# EAGLE design MiniConsoleTFT114 (EAGLE 9.6.2)
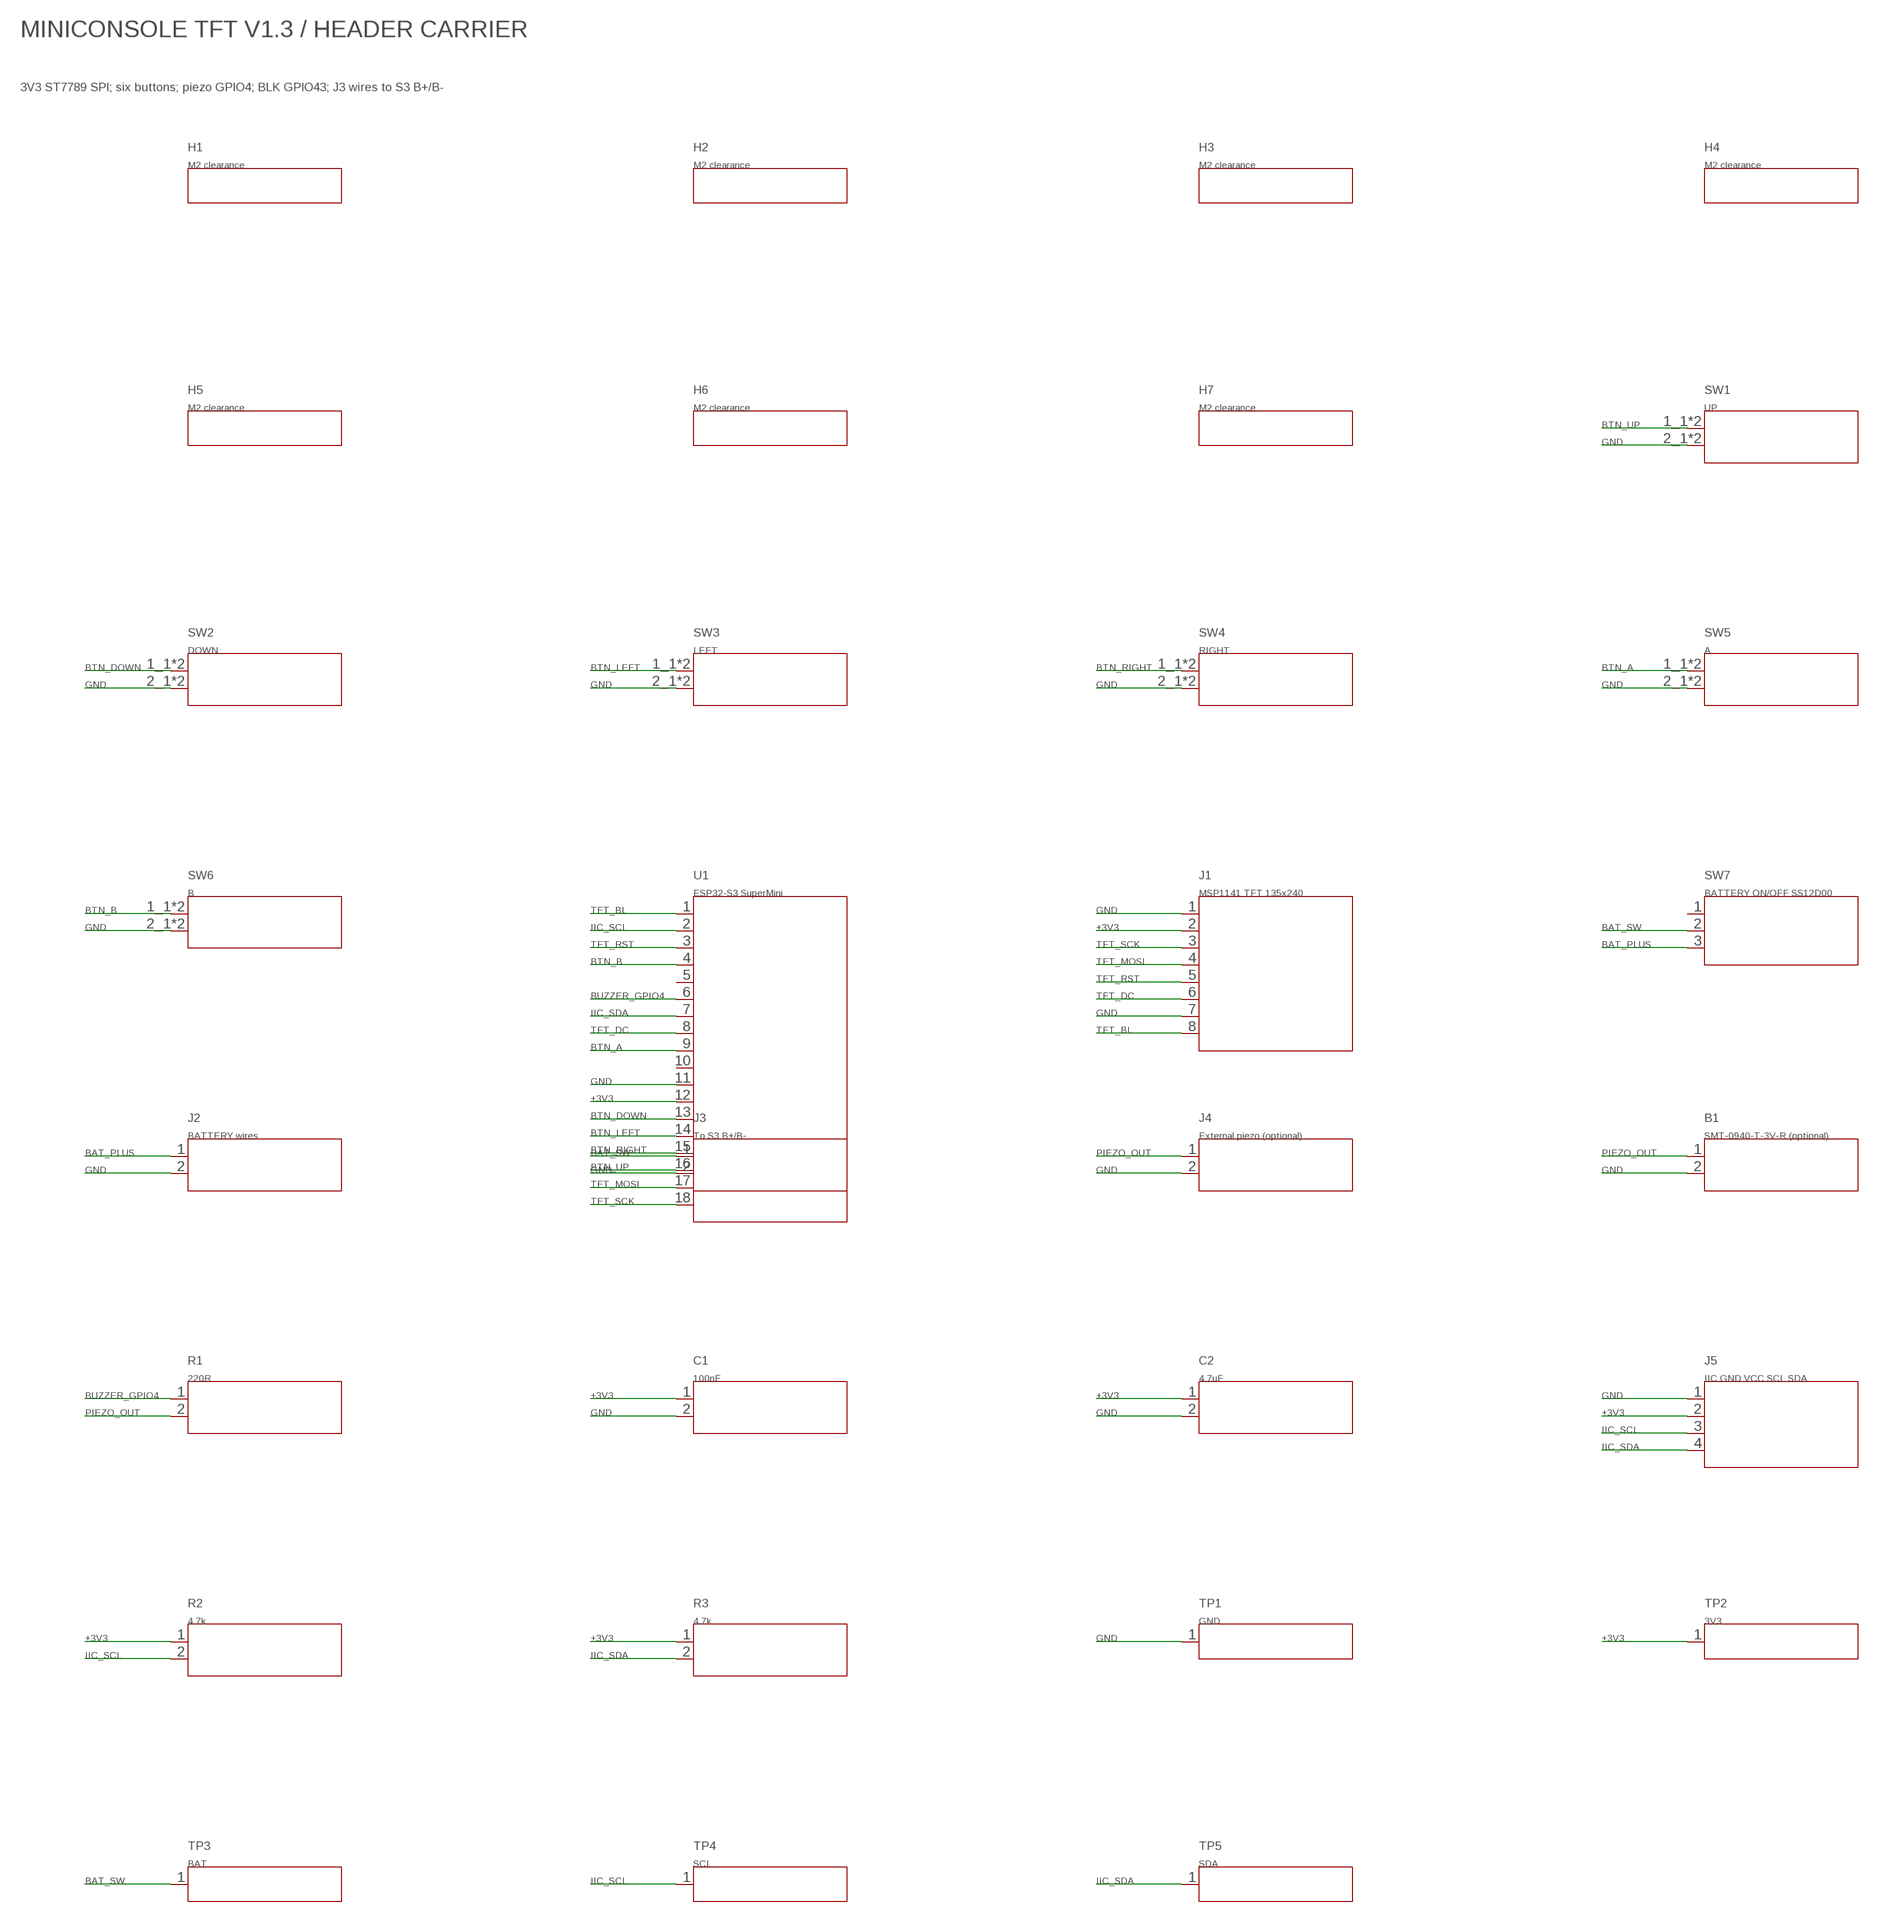
[diagram p0: schematic, sheet 1]

## Parts
B1  SMT-0940-T-3V-R (optional)  Piezo_PUI_SMT0940_180_B1  [Piezo_PUI_SMT0940_180_B1]
C1  100nF  C_0603_180_C1  [C_0603_180_C1]
C2  4.7uF  C_0805_4u7_C2  [C_0805_4u7_C2]
H1  M2 clearance  Mount_M2_H1  [Mount_M2_H1]
H2  M2 clearance  Mount_M2_H2  [Mount_M2_H2]
H3  M2 clearance  Mount_M2_H3  [Mount_M2_H3]
H4  M2 clearance  Mount_M2_H4  [Mount_M2_H4]
H5  M2 clearance  Mount_M2_H5  [Mount_M2_H5]
H6  M2 clearance  Mount_M2_H6  [Mount_M2_H6]
H7  M2 clearance  Mount_M2_H7  [Mount_M2_H7]
J1  MSP1141 TFT 135x240  TFT_MSP1141_1x08_J1  [TFT_MSP1141_1x08_J1]
J2  BATTERY wires  Wire_2x_2.54_Reverse_J2  [Wire_2x_2.54_Reverse_J2]
J3  To S3 B+/B-  Wire_2x_2.54_J3  [Wire_2x_2.54_J3]
J4  External piezo (optional)  Wire_2x_2.54_Reverse_J4  [Wire_2x_2.54_Reverse_J4]
J5  IIC GND VCC SCL SDA  IIC_1x04_J5  [IIC_1x04_J5]
R1  220R  R_Axial_DIN0207_P7.62_220R_R1  [R_Axial_DIN0207_P7.62_220R_R1]
R2  4.7k  R_0603_R2  [R_0603_R2]
R3  4.7k  R_0603_R3  [R_0603_R3]
SW1  UP  SW_6mm_SW1  [SW_6mm_SW1]
SW2  DOWN  SW_6mm_SW2  [SW_6mm_SW2]
SW3  LEFT  SW_6mm_90_SW3  [SW_6mm_90_SW3]
SW4  RIGHT  SW_6mm_90_SW4  [SW_6mm_90_SW4]
SW5  A  SW_6mm_SW5  [SW_6mm_SW5]
SW6  B  SW_6mm_SW6  [SW_6mm_SW6]
SW7  BATTERY ON/OFF SS12D00  SS12D00_LeftEdge_3pin_SW7  [SS12D00_LeftEdge_3pin_SW7]
TP1  GND  TestPoint_D1p5_Rear_TP1  [TestPoint_D1p5_Rear_TP1]
TP2  3V3  TestPoint_D1p5_Rear_TP2  [TestPoint_D1p5_Rear_TP2]
TP3  BAT  TestPoint_D1p5_Rear_TP3  [TestPoint_D1p5_Rear_TP3]
TP4  SCL  TestPoint_D1p5_Rear_TP4  [TestPoint_D1p5_Rear_TP4]
TP5  SDA  TestPoint_D1p5_Rear_TP5  [TestPoint_D1p5_Rear_TP5]
U1  ESP32-S3 SuperMini  S3_Rear_USB_Down_2x09_U1  [S3_Rear_USB_Down_2x09_U1]

## Nets
+3V3: C1.1 C2.1 J1.2 J5.2 R2.1 R3.1 TP2.1 U1.12
BAT_PLUS: J2.1 SW7.3
BAT_SW: J3.1 SW7.2 TP3.1
BTN_A: SW5.1_1(P1) SW5.1_2(P1) U1.9
BTN_B: SW6.1_1(P1) SW6.1_2(P1) U1.4
BTN_DOWN: SW2.1_1(P1) SW2.1_2(P1) U1.13
BTN_LEFT: SW3.1_1(P1) SW3.1_2(P1) U1.14
BTN_RIGHT: SW4.1_1(P1) SW4.1_2(P1) U1.15
BTN_UP: SW1.1_1(P1) SW1.1_2(P1) U1.16
BUZZER_GPIO4: R1.1 U1.6
GND: B1.2 C1.2 C2.2 J1.1 J1.7 J2.2 J3.2 J4.2 J5.1 SW1.2_1(P2) SW1.2_2(P2) SW2.2_1(P2) SW2.2_2(P2) SW3.2_1(P2) SW3.2_2(P2) SW4.2_1(P2) SW4.2_2(P2) SW5.2_1(P2) SW5.2_2(P2) SW6.2_1(P2) SW6.2_2(P2) TP1.1 U1.11
IIC_SCL: J5.3 R2.2 TP4.1 U1.2
IIC_SDA: J5.4 R3.2 TP5.1 U1.7
PIEZO_OUT: B1.1 J4.1 R1.2
TFT_BL: J1.8 U1.1
TFT_DC: J1.6 U1.8
TFT_MOSI: J1.4 U1.17
TFT_RST: J1.5 U1.3
TFT_SCK: J1.3 U1.18
Unconnected: SW7.1 U1.5 U1.10

## Notes on the sheet
- MINICONSOLE TFT V1.3 / HEADER CARRIER
- 3V3 ST7789 SPI; six buttons; piezo GPIO4; BLK GPIO43; J3 wires to S3 B+/B-

## Library data of the parts
B1 = MiniConsole:Piezo_PUI_SMT0940_180_B1
C1 = MiniConsole:C_0603_180_C1
C2 = MiniConsole:C_0805_4u7_C2
H1 = MiniConsole:Mount_M2_H1
H2 = MiniConsole:Mount_M2_H2
H3 = MiniConsole:Mount_M2_H3
H4 = MiniConsole:Mount_M2_H4
H5 = MiniConsole:Mount_M2_H5
H6 = MiniConsole:Mount_M2_H6
H7 = MiniConsole:Mount_M2_H7
J1 = MiniConsole:TFT_MSP1141_1x08_J1
J2 = MiniConsole:Wire_2x_2.54_Reverse_J2
J3 = MiniConsole:Wire_2x_2.54_J3
J4 = MiniConsole:Wire_2x_2.54_Reverse_J4
J5 = MiniConsole:IIC_1x04_J5
R1 = MiniConsole:R_Axial_DIN0207_P7.62_220R_R1
R2 = MiniConsole:R_0603_R2
R3 = MiniConsole:R_0603_R3
SW1 = MiniConsole:SW_6mm_SW1
SW2 = MiniConsole:SW_6mm_SW2
SW3 = MiniConsole:SW_6mm_90_SW3
SW4 = MiniConsole:SW_6mm_90_SW4
SW5 = MiniConsole:SW_6mm_SW5
SW6 = MiniConsole:SW_6mm_SW6
SW7 = MiniConsole:SS12D00_LeftEdge_3pin_SW7
TP1 = MiniConsole:TestPoint_D1p5_Rear_TP1
TP2 = MiniConsole:TestPoint_D1p5_Rear_TP2
TP3 = MiniConsole:TestPoint_D1p5_Rear_TP3
TP4 = MiniConsole:TestPoint_D1p5_Rear_TP4
TP5 = MiniConsole:TestPoint_D1p5_Rear_TP5
U1 = MiniConsole:S3_Rear_USB_Down_2x09_U1

## Net classes
0 default: width 0.25 mm, drill 0.3 mm

## Board
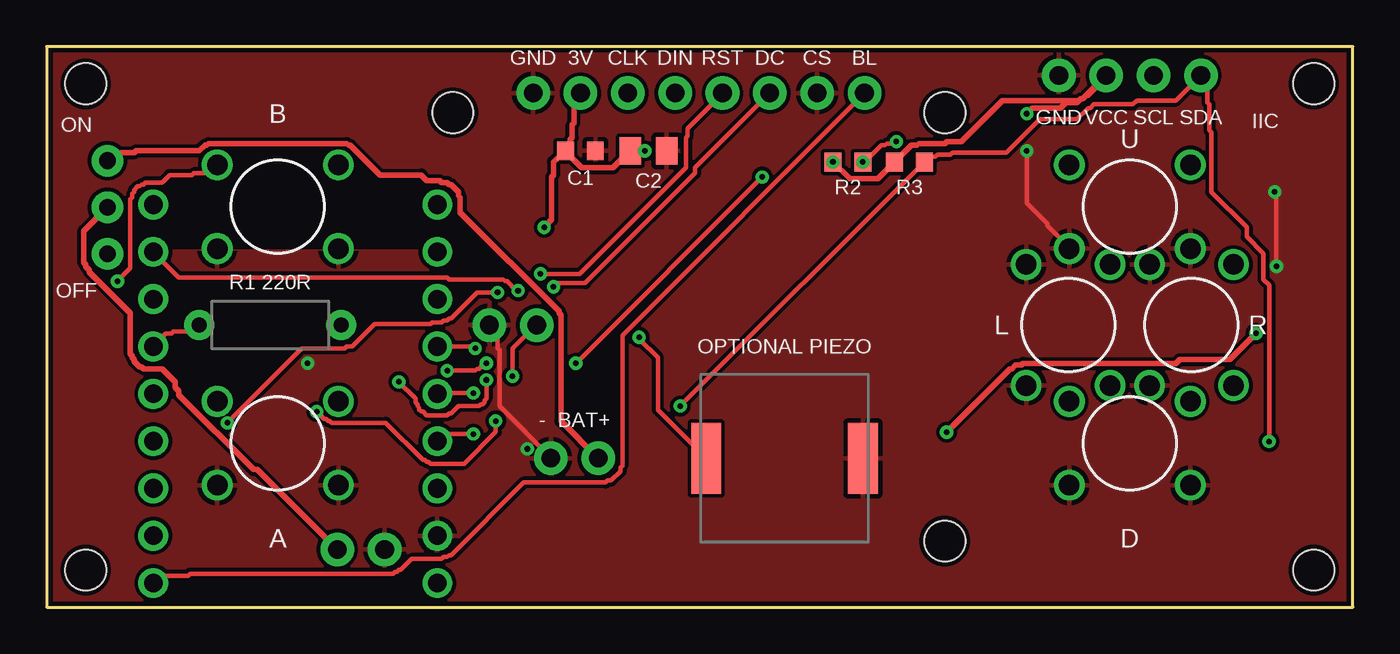
[diagram p1: board, top side]
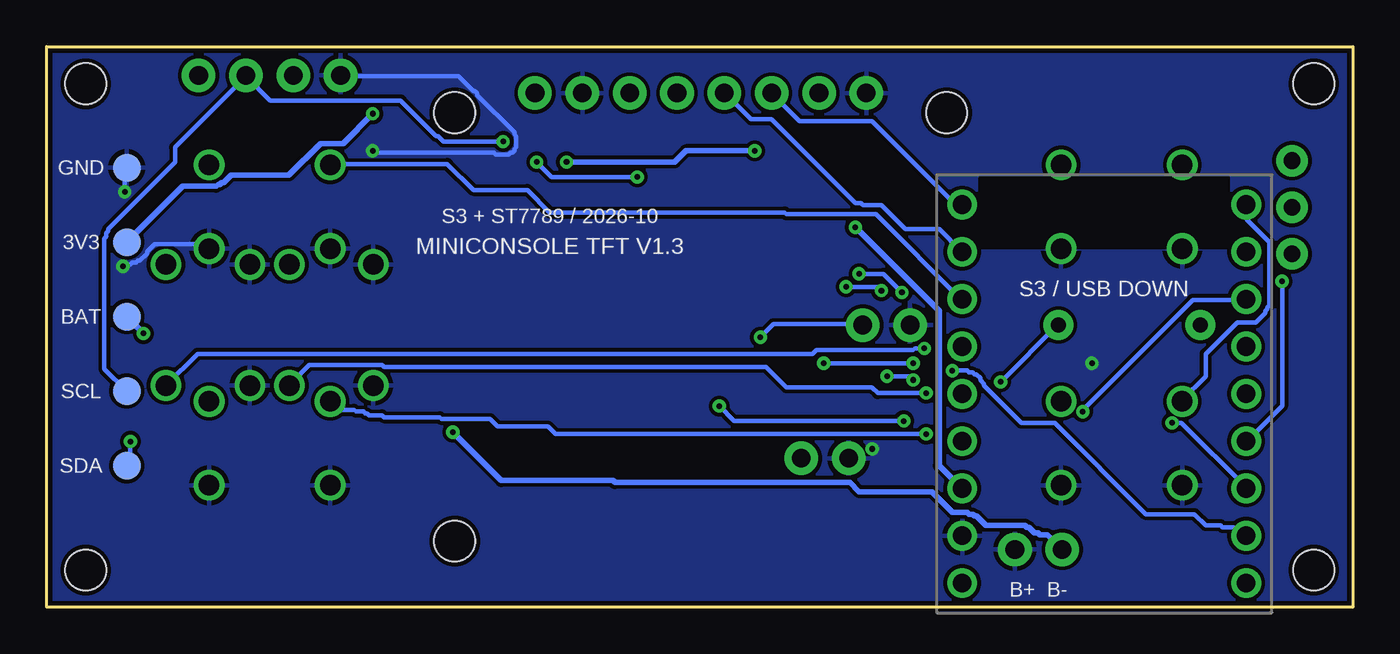
[diagram p2: board, bottom side, seen from below]

Size 70.1 x 30.1 mm. Coordinates in mm from the lower left corner, seen from the top.
Outline: 0,0 70.1,0 70.1,30.1 0,30.1 0,0
Copper layers (1*16): Top 0.035mm / dielectric 1.53mm / Bottom
Design rules "MiniConsole_2layer_0p2mm": minimum track width 0.25mm, minimum drill 0.3mm, track to track 0.2mm, track to pad 0.2mm, pad to pad 0.2mm, via to via 0.2mm, copper to edge 0.25mm, drill to drill 0.25mm, stop-mask expansion 0.05mm, thermal gap 0.25mm
tRestrict: area 6.8,19.4 to 19.9,23
bRestrict: area 6.8,19.4 to 19.9,23
vRestrict: area 6.8,19.4 to 19.9,23

### Footprints (pad centres in the part's own frame; a part is rotated, then mirrored left to right if it is on the bottom)
Piezo_PUI_SMT0940_180_B1 = smd 1.6 x 3.8: 1 -4.2,0; 2 4.2,0
C_0603_180_C1 = smd 0.9 x 1: 1 -0.8,0; 2 0.8,0
C_0805_4u7_C2 = smd 1.15 x 1.45: 1 -0.975,0; 2 0.975,0
Mount_M2_H1 = hole 2.2: 0,0
Mount_M2_H2 = hole 2.2: 0,0
Mount_M2_H3 = hole 2.2: 0,0
Mount_M2_H4 = hole 2.2: 0,0
Mount_M2_H5 = hole 2.2: 0,0
Mount_M2_H6 = hole 2.2: 0,0
Mount_M2_H7 = hole 2.2: 0,0
TFT_MSP1141_1x08_J1 = drill 1 pad 1.8 round: 1 0,0; 2 2.54,0; 3 5.08,0; 4 7.62,0; 5 10.16,0; 6 12.7,0; 7 15.24,0; 8 17.78,0
Wire_2x_2.54_Reverse_J2 = drill 1 pad 1.8 round: 1 0,0; 2 -2.54,0
Wire_2x_2.54_J3 = drill 1 pad 1.8 round: 1 0,0; 2 2.54,0
Wire_2x_2.54_Reverse_J4 = drill 1 pad 1.8 round: 1 0,0; 2 -2.54,0
IIC_1x04_J5 = drill 1 pad 1.8 round: 1 0,0; 2 2.54,0; 3 5.08,0; 4 7.62,0
R_Axial_DIN0207_P7.62_220R_R1 = drill 0.8 pad 1.6 round: 1 -3.81,0; 2 3.81,0
R_0603_R2 = smd 0.9 x 1: 1 -0.8,0; 2 0.8,0
R_0603_R3 = smd 0.9 x 1: 1 -0.8,0; 2 0.8,0
SW_6mm_SW1 = drill 1.1 pad 1.45 round: 1_1 -3.25,2.25; 1_2 3.25,2.25; 2_1 -3.25,-2.25; 2_2 3.25,-2.25
SW_6mm_SW2 = drill 1.1 pad 1.45 round: 1_1 -3.25,2.25; 1_2 3.25,2.25; 2_1 -3.25,-2.25; 2_2 3.25,-2.25
SW_6mm_90_SW3 = drill 1.1 pad 1.45 round: 1_1 2.25,3.25; 1_2 2.25,-3.25; 2_1 -2.25,3.25; 2_2 -2.25,-3.25
SW_6mm_90_SW4 = drill 1.1 pad 1.45 round: 1_1 2.25,3.25; 1_2 2.25,-3.25; 2_1 -2.25,3.25; 2_2 -2.25,-3.25
SW_6mm_SW5 = drill 1.1 pad 1.45 round: 1_1 -3.25,2.25; 1_2 3.25,2.25; 2_1 -3.25,-2.25; 2_2 3.25,-2.25
SW_6mm_SW6 = drill 1.1 pad 1.45 round: 1_1 -3.25,2.25; 1_2 3.25,2.25; 2_1 -3.25,-2.25; 2_2 3.25,-2.25
SS12D00_LeftEdge_3pin_SW7 = drill 0.9 pad 1.7 round: 1 0,-2.5; 2 0,0; 3 0,2.5
TestPoint_D1p5_Rear_TP1 = smd 1.5 x 1.5: 1 0,0
TestPoint_D1p5_Rear_TP2 = smd 1.5 x 1.5: 1 0,0
TestPoint_D1p5_Rear_TP3 = smd 1.5 x 1.5: 1 0,0
TestPoint_D1p5_Rear_TP4 = smd 1.5 x 1.5: 1 0,0
TestPoint_D1p5_Rear_TP5 = smd 1.5 x 1.5: 1 0,0
S3_Rear_USB_Down_2x09_U1 = drill 1 pad 1.6 round: 1 7.62,-10.16; 2 7.62,-7.62; 3 7.62,-5.08; 4 7.62,-2.54; 5 7.62,0; 6 7.62,2.54; 7 7.62,5.08; 8 7.62,7.62; 9 7.62,10.16; 10 -7.62,-10.16; 11 -7.62,-7.62; 12 -7.62,-5.08; 13 -7.62,-2.54; 14 -7.62,0; 15 -7.62,2.54; 16 -7.62,5.08; 17 -7.62,7.62; 18 -7.62,10.16

### Placement (x,y rotation side)
B1  39.6,8 0 top
C1  28.65,24.5 0 top
C2  32.3,24.5 0 top
H1  68,2 0 top
H2  2.1,2 0 top
H3  68,28.1 0 top
H4  2.1,28.1 0 top
H5  21.8,26.55 0 top
H6  48.2,26.55 0 top
H7  48.2,3.55 0 top
J1  26.11,27.61 0 top
J2  29.6,8 0 top
J3  15.6,3.1 0 top
J4  26.3,15.15 0 top
J5  54.32,28.55 0 top
R1  12,15.15 0 top
R2  43,23.9 0 top
R3  46.3,23.9 0 top
SW1  58.13,21.5 0 top
SW2  58.13,8.8 0 top
SW3  54.82,15.15 0 top
SW4  61.44,15.15 0 top
SW5  12.41,8.8 0 top
SW6  12.41,21.5 0 top
SW7  3.27,21.47 0 top
TP1  65.8,23.6 0 bottom
TP2  65.8,19.6 0 bottom
TP3  65.8,15.6 0 bottom
TP4  65.8,11.6 0 bottom
TP5  65.8,7.6 0 bottom
U1  13.35,11.46 0 bottom

### Tracks (layer width: path | path; a pad name or v marks a point on that pad's centre or on a via)
+3V3  (via drill 0.3 pad 0.6)
  Top 0.3: 31.3,24.5 v32.1,24.5 | 55.5,27.3 55.4,27.2 51.3,27.2 49.1,25 48.3,25 48.2,24.9 46.8,24.9 46.7,24.8 46.4,24.8 R3.1 44.6,23 43.1,23 R2.1 | 56.9,28.5 J5.2 56.9,28.5 | 27.8,24.5 28.7,23.6 30.4,23.6 31.3,24.5 | 56.9,28.5 55.9,27.5 55.8,27.5 55.6,27.3 | 27.8,24.5 27.2,23.9 27.2,23.2 27.1,23.1 27.1,20.8 v26.7,20.4 | 55.5,27.3 55.6,27.3 | 55.5,27.3 55.3,27.1 54.7,27.1 54.4,26.8 52.9,26.8 v52.6,26.5 | C1.1 27.8,24.5 | J1.2 28.6,27.6 28.4,27.4 28.4,26.9 28.3,26.8 28.3,26 28.2,25.9 28.2,25.2 28.1,25.1 28.1,24.9 28,24.8 28,24.7 27.8,24.5 | 56.9,28.5 56.5,28.1 56.4,28.1 55.6,27.3 | C1.1 27.8,24.5 | 55.6,27.3 55.5,27.3 | 31.3,24.5 C2.1 31.3,24.5 | C1.1 27.8,24.5
  Bottom 0.3: v26.7,20.4 22.2,15.9 22.2,7.6 21,6.4 U1.12 | TP2.1 62.8,22.6 61,22.6 60.9,22.7 60.8,22.7 60.7,22.8 60.6,22.8 60.2,23.2 57.1,23.2 55.4,24.9 54.2,24.9 v52.6,26.5 | R2.1 36.4,23.9 35.8,24.5 v32.1,24.5
  other vias: 42.2,23.9
BAT_PLUS
  Top 0.3: SW7.3 3.3,24 3.5,24.2 3.6,24.2 3.7,24.3 3.9,24.3 4,24.4 4.7,24.4 4.8,24.5 8.2,24.5 8.5,24.8 8.6,24.8 8.7,24.9 16.1,24.9 16.2,24.8 16.3,24.8 17.9,23.2 20.1,23.2 20.4,22.9 21.1,22.9 21.2,22.8 21.5,22.8 21.6,22.7 21.7,22.7 22.1,22.3 22.1,22.1 22.2,22 22.2,21.2 27.5,15.9 27.5,15.8 27.6,15.7 27.6,10 J2.1
BAT_SW  (via drill 0.3 pad 0.6)
  Top 0.3: SW7.2 3.3,21.5 2,20.2 2,18.5 2.1,18.4 2.1,18.3 2.3,18.1 2.3,18 4.5,15.8 4.5,13.6 4.6,13.5 4.6,13.4 4.7,13.3 4.7,13.2 5,12.9 5.1,12.9 5.2,12.8 6.2,12.8 6.9,12.1 6.9,11.8 7.1,11.6 7.1,11.4 11.1,7.4 11.3,7.4 J3.1 | v48.3,9.4 51.7,12.8 51.8,12.8 52,13 52.3,13 52.4,13.1 60.6,13.1 60.8,13.3 63.5,13.3 v64.9,14.7
  Bottom 0.3: v64.9,14.7 TP3.1 | v48.3,9.4 45.7,6.8 39.7,6.8 39.6,6.7 27,6.7 26.5,6.2 22.6,6.2 21.5,5.1 20.7,5.1 20.6,5 20.4,5 20.3,4.9 20.2,4.9 19.7,4.4 17.6,4.4 17.5,4.3 17.4,4.3 17.1,4 16.9,4 16.8,3.9 16.4,3.9 J3.1
BTN_A
  Bottom 0.25: SW5.1_1 9.2,11.1 7.9,12.4 7.9,13.6 6.2,15.3 5.2,15.3 4.7,15.8 4.7,15.9 4.6,16 4.6,16.1 4.5,16.2 4.5,19.6 5.7,20.8 5.7,21.6 U1.9
BTN_B  (via drill 0.3 pad 0.6)
  Top 0.25: SW6.1_1 9.2,23.8 8.8,23.4 8.7,23.4 8.6,23.3 7.9,23.3 7.8,23.2 6.6,23.2 6.2,22.8 5.3,22.8 5.2,22.7 5.1,22.7 5,22.6 4.9,22.6 4.7,22.4 4.7,22.3 4.6,22.2 4.6,22 4.5,21.9 4.5,18.2 v3.8,17.5
  Bottom 0.25: U1.4 5.7,8.9 3.8,10.8 v3.8,17.5
BTN_DOWN  (via drill 0.3 pad 0.6)
  Top 0.25: U1.13 21,8.9 21.4,9.3 v22.9,9.3
  Bottom 0.25: SW2.1_1 54.9,11.1 54.5,10.7 54.3,10.7 54.2,10.6 53.6,10.6 53.5,10.5 53.1,10.5 53,10.4 52.9,10.4 52.8,10.3 52.1,10.3 52,10.2 49,10.2 48.9,10.1 46.3,10.1 45.9,9.7 43.2,9.7 42.8,9.3 v22.9,9.3
BTN_LEFT  (via drill 0.3 pad 0.6)
  Top 0.25: v22.9,11.5 21,11.5 U1.14
  Bottom 0.25: SW3.1_2 57.1,11.9 56,13 52.1,13 52,12.9 31.5,12.9 30.4,11.8 25.8,11.8 25.5,11.5 v22.9,11.5
BTN_RIGHT  (via drill 0.3 pad 0.6)
  Top 0.25: U1.15 21,14 22.9,14 v23,13.9
  Bottom 0.25: v23,13.9 23.5,13.9 23.6,13.8 28.8,13.8 29,13.6 62,13.6 SW4.1_2
BTN_UP
  Bottom 0.25: SW1.1_1 54.9,23.8 48.6,23.8 47.2,22.4 44.3,22.4 43.1,21.2 30.5,21.2 30.4,21.1 25.6,21.1 21,16.5 U1.16
BUZZER_GPIO4
  Top 0.25: R1.1 8.2,15.2 8,15 7.9,15 7.8,14.9 7.6,14.9 7.5,14.8 6.8,14.8 6.7,14.7 6.4,14.7 5.7,14 U1.6
GND  (via drill 0.3 pad 0.6)
  Top 0.25: v52.6,24.5 52.6,21.7 53.7,20.6 53.7,20.5 54.9,19.3 SW1.2_1 | J4.2 23.8,15.2 24.1,14.9 24.1,14.6 24.2,14.5 24.2,13.9 24.3,13.8 24.3,10.8 27.1,8 J2.2 | v66,18.3 66,22.2 v65.9,22.3
  Bottom 0.25: J5.1 54.3,28.5 48,28.5 47.2,27.7 47.1,27.7 47,27.6 47,27.5 45,25.5 45,25.4 44.9,25.3 44.9,24.7 45,24.6 45,24.5 45.1,24.4 45.2,24.4 45.3,24.3 46,24.3 46.1,24.4 52.5,24.4 v52.6,24.5 | v66,18.3 65.9,18.4 65.6,18.4 65.5,18.5 65.3,18.5 65.2,18.6 65.1,18.6 64.7,19 64.7,19.1 64.3,19.5 61.6,19.5 61.4,19.3 SW1.2_2 | TP1.1 65.9,23.5 v65.9,22.3
  other vias: 14,13.1 25.8,8.5
  pour Top (isolate 0.2): 0.3,0.3 69.8,0.3 69.8,29.8 0.3,29.8
  pour Bottom (isolate 0.2): 0.3,0.3 69.8,0.3 69.8,29.8 0.3,29.8
IIC_SCL  (via drill 0.3 pad 0.6)
  Top 0.25: v45.6,25 45.5,24.9 45.1,24.9 45,24.8 44.8,24.8 44.1,24.1 44,24.1 R2.2 | v23.6,13.1 23.4,12.9 23.3,12.9 23.2,12.8 23.1,12.8 23,12.7 v21.5,12.7 | v28.4,13.1 v38.4,23.1
  Bottom 0.25: TP4.1 67,12.8 67,19.8 66.9,19.9 66.9,20.1 66.8,20.2 66.8,20.3 63.2,23.9 63.2,24.7 59.4,28.5 | v23.6,13.1 v28.4,13.1 | R2.2 43,23.1 v38.4,23.1 | 59.4,28.5 J5.3 59.4,28.5 | U1.2 5.7,3.8 6.1,4.2 6.3,4.2 6.4,4.3 7,4.3 7.1,4.4 7.9,4.4 8.5,5 11.1,5 16,9.9 17.8,9.9 19.8,11.9 19.8,12 20,12.2 20,12.3 20.2,12.5 20.3,12.5 20.4,12.6 20.6,12.6 20.7,12.7 v21.5,12.7 | v45.6,25 48.8,25 49.1,25.3 49.2,25.3 51.1,27.2 58.1,27.2 59.4,28.5
  other vias: 43.8,23.9
IIC_SDA  (via drill 0.3 pad 0.6)
  Top 0.25: 61.9,28.5 62.1,28.3 62.1,28.2 62.2,28.1 62.2,27.9 62.3,27.8 62.3,27.1 62.4,27 62.4,25.6 62.5,25.5 62.5,22.3 64.4,20.4 64.4,19.9 65.3,19 65.3,17.6 65.6,17.3 v65.6,8.9 | 61.9,28.5 60.6,27.2 58.5,27.2 58.3,27 56.2,27 56,26.8 55.9,26.8 55.3,26.2 53.3,26.2 51.5,24.4 48.6,24.4 48.5,24.3 47.8,24.3 47.7,24.2 47.5,24.2 47.4,24.1 47.3,24.1 R3.2 v34,10.8 | 61.9,28.5 J5.4 61.9,28.5 | v24.1,10 24.1,9.4 22.4,7.7 20.6,7.7 20.5,7.8 20.4,7.8 20.3,7.9 20.2,7.9 18.2,9.9 15.3,9.9 15.2,10 15.1,10 15,10.1 14.9,10.1 v14.5,10.5
  Bottom 0.25: TP5.1 65.6,7.8 v65.6,8.9 | v14.5,10.5 14.5,10.6 8.6,16.5 5.7,16.5 U1.7 | v34,10.8 33.2,10 v24.1,10
PIEZO_OUT  (via drill 0.3 pad 0.6)
  Top 0.25: v31.8,14.5 31.8,14.4 32.8,13.4 32.8,10.6 B1.1 | v18.9,12.1 19.8,11.2 19.8,11 19.9,10.9 19.9,10.8 20,10.7 20,10.6 20.1,10.5 20.2,10.5 20.4,10.3 21.5,10.3 21.6,10.4 21.7,10.4 22.1,10.8 23.2,10.8 23.3,10.9 23.4,10.9 23.5,11 23.5,11.1 23.6,11.2 v23.6,12.2 | J4.1 26.3,15.2 25,13.9 v25,12.4
  Bottom 0.25: v23.6,12.2 23.8,12.4 v25,12.4 | R1.2 15.8,15.2 v18.9,12.1 | v31.8,14.5 31.1,15.2 26.3,15.2 J4.1
TFT_BL
  Top 0.25: J1.8 30.9,14.6 30.9,7.6 30.8,7.5 30.8,7.3 30.3,6.8 30.1,6.8 30,6.7 25.6,6.7 21.7,2.8 21.6,2.8 21.5,2.7 21.3,2.7 21.2,2.6 19.6,2.6 19,2 18.9,2 18.8,1.9 18.7,1.9 18.6,1.8 7.7,1.8 7.6,1.7 6.1,1.7 5.7,1.3 U1.1
TFT_DC  (via drill 0.3 pad 0.6)
  Top 0.25: J1.6 34.8,23.6 34.8,23.3 28.9,17.4 27.4,17.4 v27.2,17.2 | U1.8 5.7,19.1 7.1,17.7 21.5,17.7 21.6,17.6 24.5,17.6 24.6,17.5 24.7,17.5 25.2,17 v25.3,17
  Bottom 0.25: v27.2,17.2 25.5,17.2 v25.3,17
TFT_MOSI
  Bottom 0.25: J1.4 33.7,27.6 32.3,26.2 31.2,26.2 26.7,21.7 26.4,21.7 26.3,21.6 25.3,21.6 24,20.3 22.2,20.3 21,19.1 U1.17
TFT_RST  (via drill 0.3 pad 0.6)
  Top 0.25: v24.2,16.9 23.1,16.9 21.7,15.5 21.6,15.5 21.5,15.4 21.3,15.4 21.2,15.3 20.7,15.3 20.6,15.2 17.6,15.2 16.4,14 16.1,14 16,13.9 13.7,13.9 v9.7,9.9 | J1.5 36.3,27.6 34.4,25.7 34.4,25.3 34.3,25.2 34.3,23.6 28.6,17.9 v26.5,17.9
  Bottom 0.25: U1.3 5.7,6.4 9.2,9.9 v9.7,9.9 | v26.5,17.9 25.2,17.9 v24.2,16.9
TFT_SCK
  Bottom 0.25: J1.3 29.7,26.1 25.8,26.1 21.4,21.7 21.1,21.7 21,21.6 U1.18

### Text on the board
tPlace: GND | 3V | CLK | DIN | RST | DC | CS | BL | ON | B | GND | VCC | SCL | SDA | IIC | U | C1 | C2 | R2 | R3 | OFF | R1 220R | L | R | OPTIONAL PIEZO | - BAT+ | A | D
bPlace: GND | S3 + ST7789 / 2026-10 | 3V3 | MINICONSOLE TFT V1.3 | S3 / USB DOWN | BAT | SCL | SDA | B+ B-